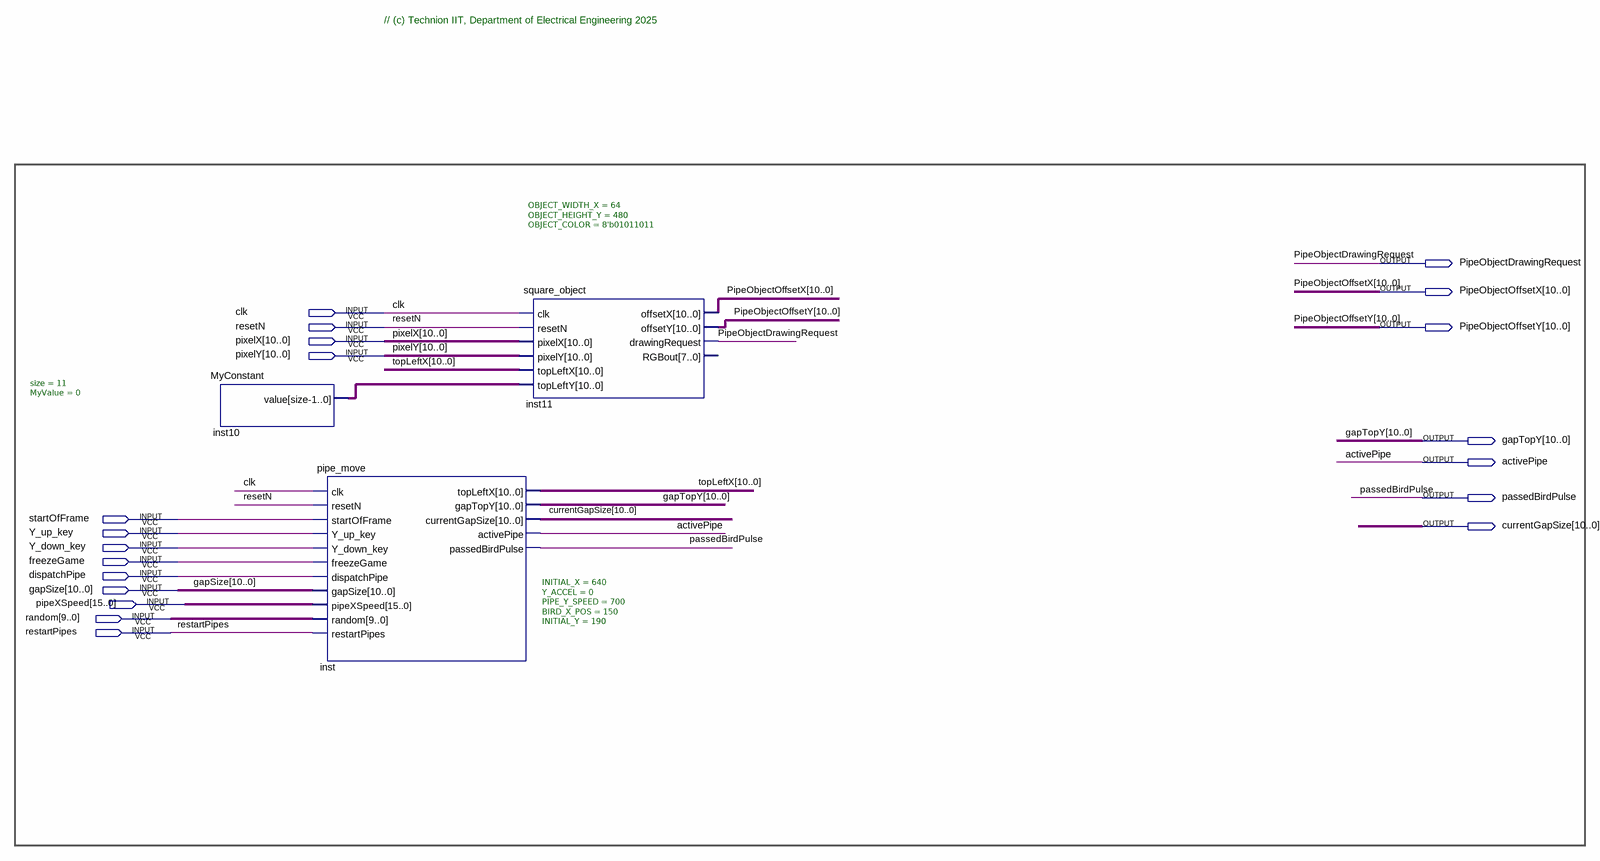
[diagram p0: schematic sheet]
// Quartus schematic Pipe_Object.bdf as structural Verilog: 3 symbols, 20 pins
module Pipe_Object (
  input  clk,
  input  resetN,
  input  [10:0] pixelX,
  input  [10:0] pixelY,
  input  startOfFrame,
  input  Y_up_key,
  input  Y_down_key,
  input  freezeGame,
  input  dispatchPipe,
  input  [10:0] gapSize,
  input  [15:0] pipeXSpeed,
  input  [9:0] random,
  input  restartPipes,
  output PipeObjectDrawingRequest,
  output [10:0] PipeObjectOffsetX,
  output [10:0] PipeObjectOffsetY,
  output [10:0] gapTopY,
  output activePipe,
  output passedBirdPulse,
  output [10:0] currentGapSize
);

  wire [10:0] inst10_value, topLeftX;

  MyConstant #(.size(11), .MyValue(0)) inst10 (.value(inst10_value));
  pipe_move #(.INITIAL_X(640), .Y_ACCEL(0), .PIPE_Y_SPEED(700), .BIRD_X_POS(150), .INITIAL_Y(190)) inst (
    .clk(clk), .resetN(resetN), .startOfFrame(startOfFrame), .Y_up_key(Y_up_key), .Y_down_key(Y_down_key),
    .freezeGame(freezeGame), .dispatchPipe(dispatchPipe), .gapSize(gapSize), .pipeXSpeed(pipeXSpeed),
    .random(random), .restartPipes(restartPipes), .topLeftX(topLeftX), .gapTopY(gapTopY),
    .currentGapSize(currentGapSize), .activePipe(activePipe), .passedBirdPulse(passedBirdPulse));
  square_object #(.OBJECT_WIDTH_X(64), .OBJECT_HEIGHT_Y(480), .OBJECT_COLOR(8'b01011011)) inst11 (
    .clk(clk), .resetN(resetN), .pixelX(pixelX), .pixelY(pixelY), .topLeftX(topLeftX),
    .topLeftY(inst10_value), .offsetX(PipeObjectOffsetX), .offsetY(PipeObjectOffsetY),
    .drawingRequest(PipeObjectDrawingRequest));  // open: RGBout

  // Notes on the sheet:
  //   // (c) Technion IIT, Department of Electrical Engineering 2025
endmodule
